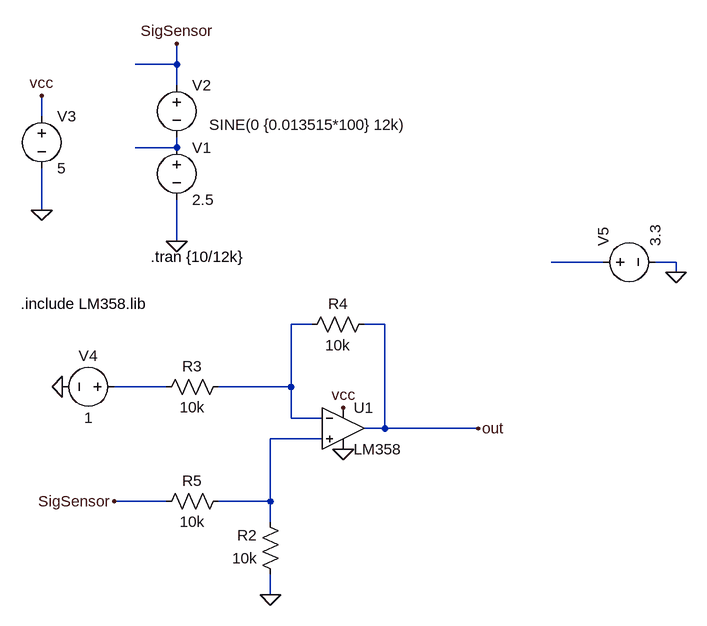
[diagram p0: schematic SS49E.asc]
SS49E.asc, the LTspice schematic file:
Version 4.1
SHEET 1 880 852
WIRE 48 16 48 -16
WIRE 48 16 -16 16
WIRE 48 48 48 16
WIRE -160 96 -160 64
WIRE 48 144 48 128
WIRE 48 144 -16 144
WIRE -160 240 -160 176
WIRE 48 288 48 224
WIRE 704 320 624 320
WIRE 816 320 784 320
WIRE 816 336 816 320
WIRE 256 416 224 416
WIRE 368 416 336 416
WIRE 32 512 -48 512
WIRE 224 512 224 416
WIRE 224 512 112 512
WIRE 224 560 224 512
WIRE 272 560 224 560
WIRE 368 576 368 416
WIRE 368 576 336 576
WIRE 512 576 368 576
WIRE 272 592 192 592
WIRE 32 688 -48 688
WIRE 192 688 192 592
WIRE 192 688 112 688
WIRE 192 720 192 688
WIRE 192 832 192 800
FLAG 48 288 0
FLAG 48 -16 SigSensor
FLAG -160 240 0
FLAG -160 64 vcc
FLAG 304 608 0
FLAG 304 544 vcc
FLAG 192 832 0
FLAG -48 688 SigSensor
FLAG -128 512 0
FLAG 512 576 out
FLAG 816 336 0
SYMBOL voltage 48 128 R0
WINDOW 123 0 0 Left 0
WINDOW 39 0 0 Left 0
SYMATTR InstName V1
SYMATTR Value 2.5
SYMBOL voltage 48 32 R0
WINDOW 3 50 77 Left 2
WINDOW 123 0 0 Left 0
WINDOW 39 0 0 Left 0
SYMATTR Value SINE(0 {0.013515*100} 12k)
SYMATTR InstName V2
SYMBOL OpAmps\\opamp2 304 512 R0
SYMATTR InstName U1
SYMATTR Value LM358
SYMBOL voltage -160 80 R0
WINDOW 123 0 0 Left 0
WINDOW 39 0 0 Left 0
SYMATTR InstName V3
SYMATTR Value 5
SYMBOL res 208 816 R180
WINDOW 0 36 76 Left 2
WINDOW 3 36 40 Left 2
SYMATTR InstName R2
SYMATTR Value 10k
SYMBOL res 128 496 R90
WINDOW 0 0 56 VBottom 2
WINDOW 3 32 56 VTop 2
SYMATTR InstName R3
SYMATTR Value 10k
SYMBOL res 352 400 R90
WINDOW 0 0 56 VBottom 2
WINDOW 3 32 56 VTop 2
SYMATTR InstName R4
SYMATTR Value 10k
SYMBOL res 128 672 R90
WINDOW 0 0 56 VBottom 2
WINDOW 3 32 56 VTop 2
SYMATTR InstName R5
SYMATTR Value 10k
SYMBOL voltage -32 512 R90
WINDOW 0 -32 56 VBottom 2
WINDOW 3 32 56 VTop 2
WINDOW 123 0 0 Left 0
WINDOW 39 0 0 Left 0
SYMATTR InstName V4
SYMATTR Value 1
SYMBOL voltage 688 320 R270
WINDOW 123 0 0 Left 0
WINDOW 39 0 0 Left 0
SYMATTR InstName V5
SYMATTR Value 3.3
TEXT 8 312 Left 2 !.tran {10/12k}
TEXT -192 384 Left 2 !.include LM358.lib

The netlist it stands for:
* SS49E.asc
V1 N001 0 2.5
V2 SigSensor N001 SINE(0 {0.013515*100} 12k)
X§U1 N005 N003 vcc 0 out LM358  ; pins In+ In- V+ V- OUT
V3 vcc 0 5
R2 0 N005 10k
R3 N003 N004 10k
R4 out N003 10k
R5 N005 SigSensor 10k
V4 N004 0 1
V5 N002 0 3.3
.tran {10/12k}
.include LM358.lib
.backanno
.end